# Altium project Carrier-Board-v1.0.PrjPcb (part 1 of 9)
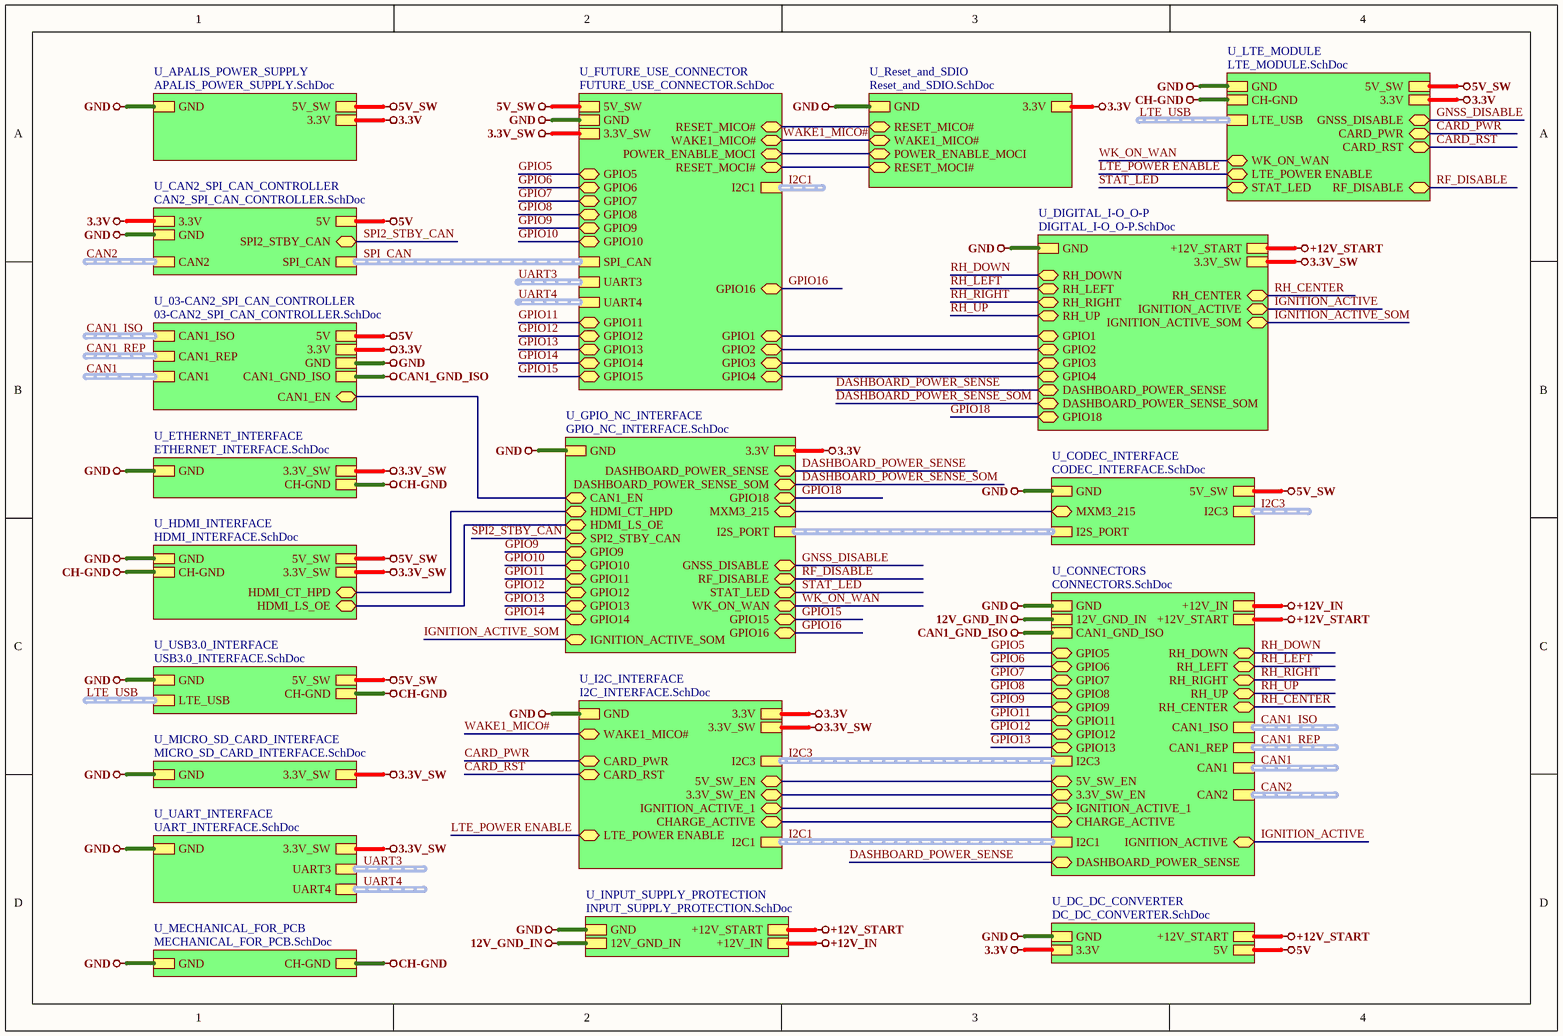
[diagram p0: Top_Sheet.SchDoc]
20 sheets, 430 parts. Net scope: hierarchical (ports join the sheet entries above them; power ports are global).
Board file: Carrier-Board-v1.0.PcbDoc
Sheets:
  Top_Sheet.SchDoc
    U_APALIS_POWER_SUPPLY = APALIS_POWER_SUPPLY.SchDoc
    U_CAN2_SPI_CAN_CONTROLLER = CAN2_SPI_CAN_CONTROLLER.SchDoc
    U_03-CAN2_SPI_CAN_CONTROLLER = 03-CAN2_SPI_CAN_CONTROLLER.SchDoc
    U_ETHERNET_INTERFACE = ETHERNET_INTERFACE.SchDoc
    U_HDMI_INTERFACE = HDMI_INTERFACE.SchDoc
    U_USB3.0_INTERFACE = USB3.0_INTERFACE.SchDoc
    U_MICRO_SD_CARD_INTERFACE = MICRO_SD_CARD_INTERFACE.SchDoc
    U_UART_INTERFACE = UART_INTERFACE.SchDoc
    U_FUTURE_USE_CONNECTOR = FUTURE_USE_CONNECTOR.SchDoc
    U_Reset_and_SDIO = Reset_and_SDIO.SchDoc
    U_I2C_INTERFACE = I2C_INTERFACE.SchDoc
    U_GPIO_NC_INTERFACE = GPIO_NC_INTERFACE.SchDoc
    U_DIGITAL_I-O_O-P = DIGITAL_I-O_O-P.SchDoc
    U_CONNECTORS = CONNECTORS.SchDoc
    U_INPUT_SUPPLY_PROTECTION = INPUT_SUPPLY_PROTECTION.SchDoc
    U_DC_DC_CONVERTER = DC_DC_CONVERTER.SchDoc
    U_MECHANICAL_FOR_PCB = MECHANICAL_FOR_PCB.SchDoc
    U_LTE_MODULE = LTE_MODULE.SchDoc
    U_CODEC_INTERFACE = CODEC_INTERFACE.SchDoc

## Sheet Top_Sheet.SchDoc
size A4; SheetNumber: 1; SheetTotal: 20

### Sub-sheets
U_03-CAN2_SPI_CAN_CONTROLLER = 03-CAN2_SPI_CAN_CONTROLLER.SchDoc: CAN1_ISO (harness CAN1_ISO), CAN1_REP (harness CAN1_REP), CAN1 (harness CAN1), 5V, 3.3V, GND, CAN1_GND_ISO, CAN1_EN (bidir)
U_APALIS_POWER_SUPPLY = APALIS_POWER_SUPPLY.SchDoc: 5V_SW, 3.3V, GND
U_CAN2_SPI_CAN_CONTROLLER = CAN2_SPI_CAN_CONTROLLER.SchDoc: SPI_CAN (harness SPI_CAN), 5V, 3.3V, CAN2 (harness CAN2), SPI2_STBY_CAN (bidir), GND
U_CODEC_INTERFACE = CODEC_INTERFACE.SchDoc: I2C3 (harness I2C3), 5V_SW, GND, MXM3_215 (bidir), I2S_PORT (harness I2S_PORT)
U_CONNECTORS = CONNECTORS.SchDoc: CAN1_ISO (harness CAN1_ISO), CAN1_REP (harness CAN1_REP), CAN1 (harness CAN1), CAN1_GND_ISO, GPIO5 (bidir), GPIO6 (bidir), GPIO7 (bidir), GPIO8 (bidir), I2C1 (harness I2C1), GPIO9 (bidir), GPIO11 (bidir), GPIO12 (bidir), GPIO13 (bidir), 5V_SW_EN (bidir), 3.3V_SW_EN (bidir), IGNITION_ACTIVE_1 (bidir), CHARGE_ACTIVE (bidir), +12V_START, IGNITION_ACTIVE (bidir), RH_RIGHT (bidir), RH_CENTER (bidir), RH_UP (bidir), RH_DOWN (bidir), RH_LEFT (bidir), DASHBOARD_POWER_SENSE (bidir), I2C3 (harness I2C3), +12V_IN, CAN2 (harness CAN2), GND, 12V_GND_IN
U_DC_DC_CONVERTER = DC_DC_CONVERTER.SchDoc: +12V_START, GND, 5V, 3.3V
U_DIGITAL_I-O_O-P = DIGITAL_I-O_O-P.SchDoc: RH_UP (bidir), GPIO1 (bidir), RH_DOWN (bidir), RH_LEFT (bidir), GPIO3 (bidir), RH_RIGHT (bidir), DASHBOARD_POWER_SENSE (bidir), DASHBOARD_POWER_SENSE_SOM (bidir), RH_CENTER (bidir), GPIO18 (bidir), IGNITION_ACTIVE (bidir), IGNITION_ACTIVE_SOM (bidir), +12V_START, GND, 3.3V_SW, GPIO2 (bidir), GPIO4 (bidir)
U_ETHERNET_INTERFACE = ETHERNET_INTERFACE.SchDoc: GND, CH-GND, 3.3V_SW
U_FUTURE_USE_CONNECTOR = FUTURE_USE_CONNECTOR.SchDoc: 5V_SW, GND, 3.3V_SW, I2C1 (harness I2C1), GPIO9 (bidir), GPIO11 (bidir), GPIO12 (bidir), GPIO13 (bidir), GPIO10 (bidir), GPIO16 (bidir), GPIO15 (bidir), GPIO14 (bidir), UART3 (harness UART3), UART4 (harness UART4), GPIO1 (bidir), GPIO2 (bidir), GPIO3 (bidir), GPIO4 (bidir), GPIO5 (bidir), GPIO6 (bidir), GPIO7 (bidir), GPIO8 (bidir), SPI_CAN (harness SPI_CAN), RESET_MICO# (bidir), WAKE1_MICO# (bidir), POWER_ENABLE_MOCI (bidir), RESET_MOCI# (bidir)
U_GPIO_NC_INTERFACE = GPIO_NC_INTERFACE.SchDoc: SPI2_STBY_CAN (bidir), GND, DASHBOARD_POWER_SENSE (bidir), DASHBOARD_POWER_SENSE_SOM (bidir), CAN1_EN (bidir), HDMI_CT_HPD (bidir), HDMI_LS_OE (bidir), GPIO10 (bidir), GPIO9 (bidir), GPIO18 (bidir), GPIO16 (bidir), GPIO15 (bidir), GPIO14 (bidir), GPIO11 (bidir), GPIO12 (bidir), GPIO13 (bidir), IGNITION_ACTIVE_SOM (bidir), 3.3V, MXM3_215 (bidir), I2S_PORT (harness I2S_PORT), GNSS_DISABLE (bidir), RF_DISABLE (bidir), STAT_LED (bidir), WK_ON_WAN (bidir)
U_HDMI_INTERFACE = HDMI_INTERFACE.SchDoc: 5V_SW, GND, CH-GND, 3.3V_SW, HDMI_CT_HPD (bidir), HDMI_LS_OE (bidir)
U_I2C_INTERFACE = I2C_INTERFACE.SchDoc: GND, 3.3V, 3.3V_SW, 5V_SW_EN (bidir), 3.3V_SW_EN (bidir), I2C3 (harness I2C3), WAKE1_MICO# (bidir), I2C1 (harness I2C1), IGNITION_ACTIVE_1 (bidir), CHARGE_ACTIVE (bidir), LTE_POWER ENABLE (bidir), CARD_PWR (bidir), CARD_RST (bidir)
U_INPUT_SUPPLY_PROTECTION = INPUT_SUPPLY_PROTECTION.SchDoc: +12V_START, GND, +12V_IN, 12V_GND_IN
U_LTE_MODULE = LTE_MODULE.SchDoc: LTE_POWER ENABLE (bidir), 5V_SW, GND, CH-GND, LTE_USB (harness LTE_USB), CARD_PWR (bidir), CARD_RST (bidir), GNSS_DISABLE (bidir), RF_DISABLE (bidir), STAT_LED (bidir), 3.3V, WK_ON_WAN (bidir)
U_MECHANICAL_FOR_PCB = MECHANICAL_FOR_PCB.SchDoc: GND, CH-GND
U_MICRO_SD_CARD_INTERFACE = MICRO_SD_CARD_INTERFACE.SchDoc: GND, 3.3V_SW
U_Reset_and_SDIO = Reset_and_SDIO.SchDoc: GND, 3.3V, RESET_MICO# (bidir), WAKE1_MICO# (bidir), POWER_ENABLE_MOCI (bidir), RESET_MOCI# (bidir)
U_UART_INTERFACE = UART_INTERFACE.SchDoc: GND, 3.3V_SW, UART3 (harness UART3), UART4 (harness UART4)
U_USB3.0_INTERFACE = USB3.0_INTERFACE.SchDoc: 5V_SW, GND, CH-GND, LTE_USB (harness LTE_USB)

### Nets
3.3V: sheet U_APALIS_POWER_SUPPLY/3.3V, sheet U_CAN2_SPI_CAN_CONTROLLER/3.3V, sheet U_03-CAN2_SPI_CAN_CONTROLLER/3.3V, sheet U_Reset_and_SDIO/3.3V, sheet U_I2C_INTERFACE/3.3V, sheet U_GPIO_NC_INTERFACE/3.3V, sheet U_DC_DC_CONVERTER/3.3V, sheet U_LTE_MODULE/3.3V
3.3V_SW: sheet U_ETHERNET_INTERFACE/3.3V_SW, sheet U_HDMI_INTERFACE/3.3V_SW, sheet U_MICRO_SD_CARD_INTERFACE/3.3V_SW, sheet U_UART_INTERFACE/3.3V_SW, sheet U_FUTURE_USE_CONNECTOR/3.3V_SW, sheet U_I2C_INTERFACE/3.3V_SW, sheet U_DIGITAL_I-O_O-P/3.3V_SW
5V: sheet U_CAN2_SPI_CAN_CONTROLLER/5V, sheet U_03-CAN2_SPI_CAN_CONTROLLER/5V, sheet U_DC_DC_CONVERTER/5V
5V_SW: sheet U_APALIS_POWER_SUPPLY/5V_SW, sheet U_HDMI_INTERFACE/5V_SW, sheet U_USB3.0_INTERFACE/5V_SW, sheet U_FUTURE_USE_CONNECTOR/5V_SW, sheet U_LTE_MODULE/5V_SW, sheet U_CODEC_INTERFACE/5V_SW
12V_GND_IN: sheet U_CONNECTORS/12V_GND_IN, sheet U_INPUT_SUPPLY_PROTECTION/12V_GND_IN
+12V_IN: sheet U_CONNECTORS/+12V_IN, sheet U_INPUT_SUPPLY_PROTECTION/+12V_IN
+12V_START: sheet U_DIGITAL_I-O_O-P/+12V_START, sheet U_CONNECTORS/+12V_START, sheet U_INPUT_SUPPLY_PROTECTION/+12V_START, sheet U_DC_DC_CONVERTER/+12V_START
CAN1_GND_ISO: sheet U_03-CAN2_SPI_CAN_CONTROLLER/CAN1_GND_ISO, sheet U_CONNECTORS/CAN1_GND_ISO
CH-GND: sheet U_ETHERNET_INTERFACE/CH-GND, sheet U_HDMI_INTERFACE/CH-GND, sheet U_USB3.0_INTERFACE/CH-GND, sheet U_MECHANICAL_FOR_PCB/CH-GND, sheet U_LTE_MODULE/CH-GND
GND: sheet U_APALIS_POWER_SUPPLY/GND, sheet U_CAN2_SPI_CAN_CONTROLLER/GND, sheet U_03-CAN2_SPI_CAN_CONTROLLER/GND, sheet U_ETHERNET_INTERFACE/GND, sheet U_HDMI_INTERFACE/GND, sheet U_USB3.0_INTERFACE/GND, sheet U_MICRO_SD_CARD_INTERFACE/GND, sheet U_UART_INTERFACE/GND, sheet U_FUTURE_USE_CONNECTOR/GND, sheet U_Reset_and_SDIO/GND, sheet U_I2C_INTERFACE/GND, sheet U_GPIO_NC_INTERFACE/GND, sheet U_DIGITAL_I-O_O-P/GND, sheet U_CONNECTORS/GND, sheet U_INPUT_SUPPLY_PROTECTION/GND, sheet U_DC_DC_CONVERTER/GND, sheet U_MECHANICAL_FOR_PCB/GND, sheet U_LTE_MODULE/GND, sheet U_CODEC_INTERFACE/GND
3.3V_SW_EN: sheet U_I2C_INTERFACE/3.3V_SW_EN, sheet U_CONNECTORS/3.3V_SW_EN
5V_SW_EN: sheet U_I2C_INTERFACE/5V_SW_EN, sheet U_CONNECTORS/5V_SW_EN
CAN1_EN: sheet U_03-CAN2_SPI_CAN_CONTROLLER/CAN1_EN, sheet U_GPIO_NC_INTERFACE/CAN1_EN
CARD_PWR: sheet U_I2C_INTERFACE/CARD_PWR, sheet U_LTE_MODULE/CARD_PWR
CARD_RST: sheet U_I2C_INTERFACE/CARD_RST, sheet U_LTE_MODULE/CARD_RST
CHARGE_ACTIVE: sheet U_I2C_INTERFACE/CHARGE_ACTIVE, sheet U_CONNECTORS/CHARGE_ACTIVE
DASHBOARD_POWER_SENSE: sheet U_GPIO_NC_INTERFACE/DASHBOARD_POWER_SENSE, sheet U_DIGITAL_I-O_O-P/DASHBOARD_POWER_SENSE, sheet U_CONNECTORS/DASHBOARD_POWER_SENSE
DASHBOARD_POWER_SENSE_SOM: sheet U_GPIO_NC_INTERFACE/DASHBOARD_POWER_SENSE_SOM, sheet U_DIGITAL_I-O_O-P/DASHBOARD_POWER_SENSE_SOM
GNSS_DISABLE: sheet U_GPIO_NC_INTERFACE/GNSS_DISABLE, sheet U_LTE_MODULE/GNSS_DISABLE
GPIO1: sheet U_FUTURE_USE_CONNECTOR/GPIO1, sheet U_DIGITAL_I-O_O-P/GPIO1
GPIO2: sheet U_FUTURE_USE_CONNECTOR/GPIO2, sheet U_DIGITAL_I-O_O-P/GPIO2
GPIO3: sheet U_FUTURE_USE_CONNECTOR/GPIO3, sheet U_DIGITAL_I-O_O-P/GPIO3
GPIO4: sheet U_FUTURE_USE_CONNECTOR/GPIO4, sheet U_DIGITAL_I-O_O-P/GPIO4
GPIO5: sheet U_FUTURE_USE_CONNECTOR/GPIO5, sheet U_CONNECTORS/GPIO5
GPIO6: sheet U_FUTURE_USE_CONNECTOR/GPIO6, sheet U_CONNECTORS/GPIO6
GPIO7: sheet U_FUTURE_USE_CONNECTOR/GPIO7, sheet U_CONNECTORS/GPIO7
GPIO8: sheet U_FUTURE_USE_CONNECTOR/GPIO8, sheet U_CONNECTORS/GPIO8
GPIO9: sheet U_FUTURE_USE_CONNECTOR/GPIO9, sheet U_GPIO_NC_INTERFACE/GPIO9, sheet U_CONNECTORS/GPIO9
GPIO10: sheet U_FUTURE_USE_CONNECTOR/GPIO10, sheet U_GPIO_NC_INTERFACE/GPIO10
GPIO11: sheet U_FUTURE_USE_CONNECTOR/GPIO11, sheet U_GPIO_NC_INTERFACE/GPIO11, sheet U_CONNECTORS/GPIO11
GPIO12: sheet U_FUTURE_USE_CONNECTOR/GPIO12, sheet U_GPIO_NC_INTERFACE/GPIO12, sheet U_CONNECTORS/GPIO12
GPIO13: sheet U_FUTURE_USE_CONNECTOR/GPIO13, sheet U_GPIO_NC_INTERFACE/GPIO13, sheet U_CONNECTORS/GPIO13
GPIO14: sheet U_FUTURE_USE_CONNECTOR/GPIO14, sheet U_GPIO_NC_INTERFACE/GPIO14
GPIO15: sheet U_FUTURE_USE_CONNECTOR/GPIO15, sheet U_GPIO_NC_INTERFACE/GPIO15
GPIO16: sheet U_FUTURE_USE_CONNECTOR/GPIO16, sheet U_GPIO_NC_INTERFACE/GPIO16
GPIO18: sheet U_GPIO_NC_INTERFACE/GPIO18, sheet U_DIGITAL_I-O_O-P/GPIO18
HDMI_CT_HPD: sheet U_HDMI_INTERFACE/HDMI_CT_HPD, sheet U_GPIO_NC_INTERFACE/HDMI_CT_HPD
HDMI_LS_OE: sheet U_HDMI_INTERFACE/HDMI_LS_OE, sheet U_GPIO_NC_INTERFACE/HDMI_LS_OE
IGNITION_ACTIVE: sheet U_DIGITAL_I-O_O-P/IGNITION_ACTIVE, sheet U_CONNECTORS/IGNITION_ACTIVE
IGNITION_ACTIVE_1: sheet U_I2C_INTERFACE/IGNITION_ACTIVE_1, sheet U_CONNECTORS/IGNITION_ACTIVE_1
IGNITION_ACTIVE_SOM: sheet U_GPIO_NC_INTERFACE/IGNITION_ACTIVE_SOM, sheet U_DIGITAL_I-O_O-P/IGNITION_ACTIVE_SOM
LTE_POWER ENABLE: sheet U_I2C_INTERFACE/LTE_POWER ENABLE, sheet U_LTE_MODULE/LTE_POWER ENABLE
MXM3_215: sheet U_GPIO_NC_INTERFACE/MXM3_215, sheet U_CODEC_INTERFACE/MXM3_215
POWER_ENABLE_MOCI: sheet U_FUTURE_USE_CONNECTOR/POWER_ENABLE_MOCI, sheet U_Reset_and_SDIO/POWER_ENABLE_MOCI
RESET_MICO#: sheet U_FUTURE_USE_CONNECTOR/RESET_MICO#, sheet U_Reset_and_SDIO/RESET_MICO#
RESET_MOCI#: sheet U_FUTURE_USE_CONNECTOR/RESET_MOCI#, sheet U_Reset_and_SDIO/RESET_MOCI#
RF_DISABLE: sheet U_GPIO_NC_INTERFACE/RF_DISABLE, sheet U_LTE_MODULE/RF_DISABLE
RH_CENTER: sheet U_DIGITAL_I-O_O-P/RH_CENTER, sheet U_CONNECTORS/RH_CENTER
RH_DOWN: sheet U_DIGITAL_I-O_O-P/RH_DOWN, sheet U_CONNECTORS/RH_DOWN
RH_LEFT: sheet U_DIGITAL_I-O_O-P/RH_LEFT, sheet U_CONNECTORS/RH_LEFT
RH_RIGHT: sheet U_DIGITAL_I-O_O-P/RH_RIGHT, sheet U_CONNECTORS/RH_RIGHT
RH_UP: sheet U_DIGITAL_I-O_O-P/RH_UP, sheet U_CONNECTORS/RH_UP
SPI2_STBY_CAN: sheet U_CAN2_SPI_CAN_CONTROLLER/SPI2_STBY_CAN, sheet U_GPIO_NC_INTERFACE/SPI2_STBY_CAN
STAT_LED: sheet U_GPIO_NC_INTERFACE/STAT_LED, sheet U_LTE_MODULE/STAT_LED
WAKE1_MICO#: sheet U_FUTURE_USE_CONNECTOR/WAKE1_MICO#, sheet U_Reset_and_SDIO/WAKE1_MICO#, sheet U_I2C_INTERFACE/WAKE1_MICO#
WK_ON_WAN: sheet U_GPIO_NC_INTERFACE/WK_ON_WAN, sheet U_LTE_MODULE/WK_ON_WAN

### Buses and harness runs
harness CAN1 = sheet U_03-CAN2_SPI_CAN_CONTROLLER/CAN1
harness CAN1 = sheet U_CONNECTORS/CAN1
harness CAN1_ISO = sheet U_03-CAN2_SPI_CAN_CONTROLLER/CAN1_ISO
harness CAN1_ISO = sheet U_CONNECTORS/CAN1_ISO
harness CAN1_REP = sheet U_03-CAN2_SPI_CAN_CONTROLLER/CAN1_REP
harness CAN1_REP = sheet U_CONNECTORS/CAN1_REP
harness CAN2 = sheet U_CAN2_SPI_CAN_CONTROLLER/CAN2
harness CAN2 = sheet U_CONNECTORS/CAN2
harness I2C1 = sheet U_CONNECTORS/I2C1 = sheet U_I2C_INTERFACE/I2C1
harness I2C1 = sheet U_FUTURE_USE_CONNECTOR/I2C1
harness I2C3 = sheet U_CODEC_INTERFACE/I2C3
harness I2C3 = sheet U_CONNECTORS/I2C3 = sheet U_I2C_INTERFACE/I2C3
harness LTE_USB = sheet U_LTE_MODULE/LTE_USB
harness LTE_USB = sheet U_USB3.0_INTERFACE/LTE_USB
harness sheet U_CODEC_INTERFACE/I2S_PORT = sheet U_GPIO_NC_INTERFACE/I2S_PORT
harness SPI_CAN = sheet U_CAN2_SPI_CAN_CONTROLLER/SPI_CAN = sheet U_FUTURE_USE_CONNECTOR/SPI_CAN
harness UART3 = sheet U_FUTURE_USE_CONNECTOR/UART3
harness UART3 = sheet U_UART_INTERFACE/UART3
harness UART4 = sheet U_FUTURE_USE_CONNECTOR/UART4
harness UART4 = sheet U_UART_INTERFACE/UART4

## Sheet APALIS_POWER_SUPPLY.SchDoc
size A4; SheetNumber: 2; SheetTotal: 20
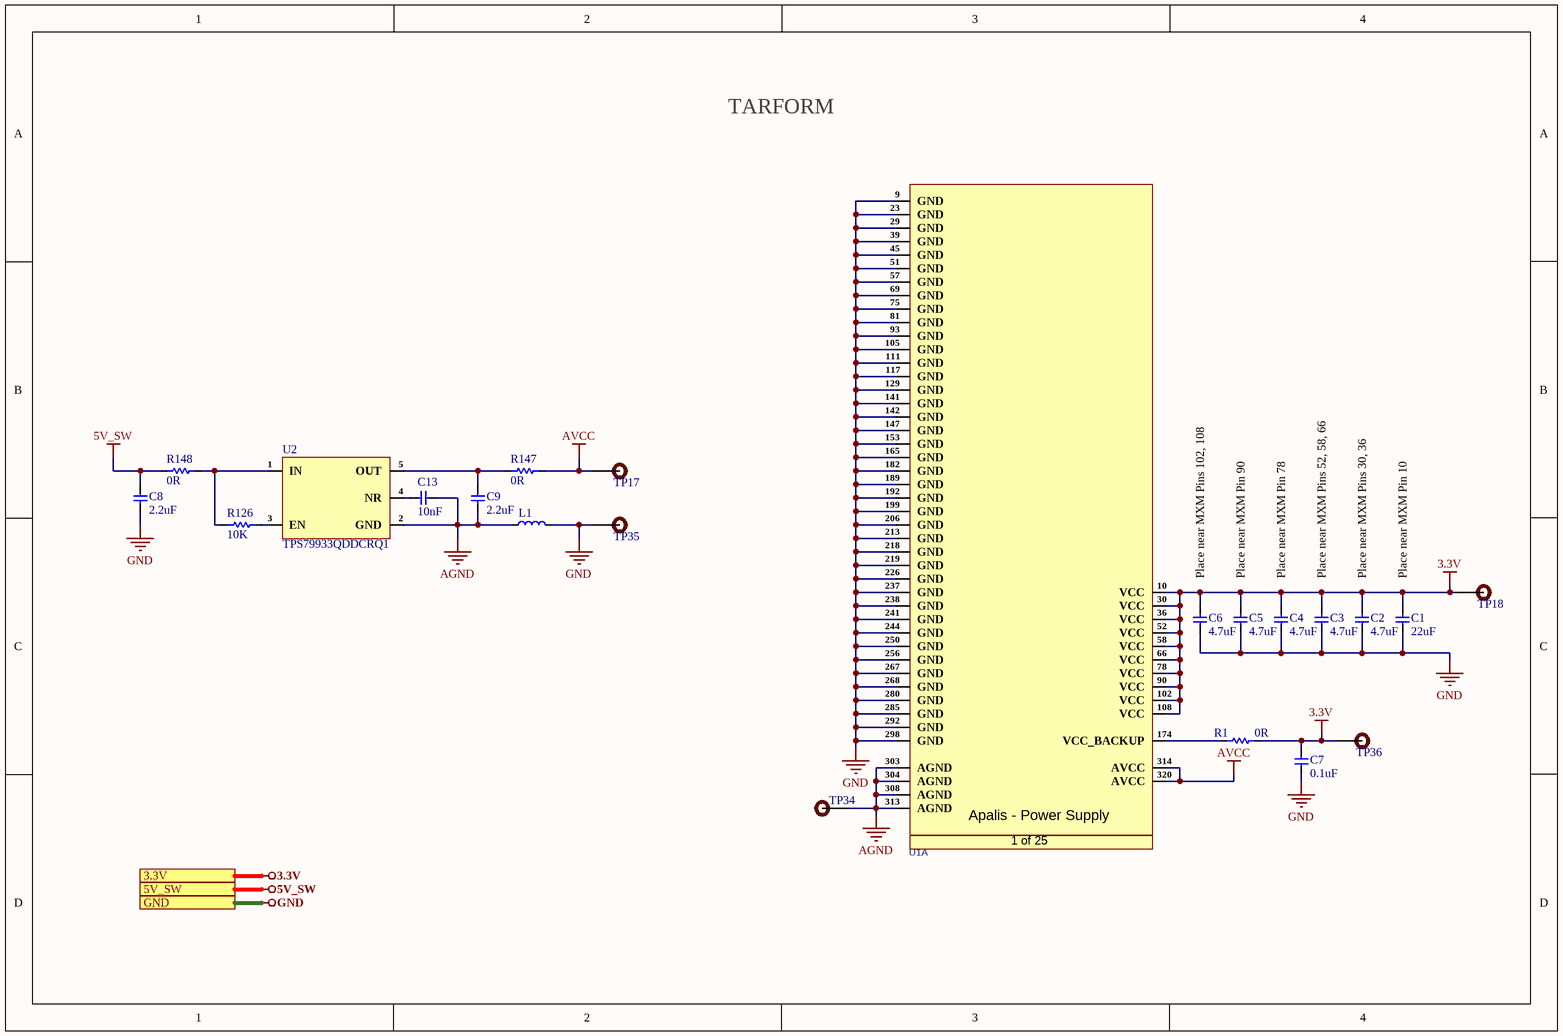
[diagram p1: APALIS_POWER_SUPPLY.SchDoc]

### Parts
C1  22uF  [Cap-0805]
C2  4.7uF  [Cap-0603]
C3  4.7uF  [Cap-0603]
C4  4.7uF  [Cap-0603]
C5  4.7uF  [Cap-0603]
C6  4.7uF  [Cap-0603]
C7  0.1uF  [Cap-0402]
C8  2.2uF  [Cap-0603]
C9  2.2uF  [Cap-0603]
C13  10nF  [Cap-0402]
L1  BLM18PG330SH1D  [IND-0603 (1608 Metric)]  (value not drawn)
R1  0R  [Res-0402]
R126  10K  [Res-0603]
R147  0R  [Res-1206]
R148  0R  [Res-1206]
TP17  DNP  [Test-point]  (value not drawn)
TP18  DNP  [Test-point]  (value not drawn)
TP34  DNP  [Test-point]  (value not drawn)
TP35  DNP  [Test-point]  (value not drawn)
TP36  DNP  [Test-point]  (value not drawn)
U1  MM70-314B1-2-R300  [MM70-314B1-2-R300]  (value not drawn)  (part A of 25)
U2  TPS79933QDDCRQ1  [SOT-23-5]

### Ports
3.3V (see Top_Sheet[1A], 03-CAN2_SPI_CAN_CONTROLLER[1D], CAN2_SPI_CAN_CONTROLLER[1D], DC_DC_CONVERTER[1D], GPIO_NC_INTERFACE[4B], I2C_INTERFACE[1B], LTE_MODULE[1D], Reset_and_SDIO[1D]), 5V_SW (see Top_Sheet[1A], CODEC_INTERFACE[1D], FUTURE_USE_CONNECTOR[1D], HDMI_INTERFACE[1D], LTE_MODULE[1D], USB3.0_INTERFACE[1D]), GND (see Top_Sheet[1A], 03-CAN2_SPI_CAN_CONTROLLER[1D], CAN2_SPI_CAN_CONTROLLER[1D], CODEC_INTERFACE[1D], CONNECTORS[1D], DC_DC_CONVERTER[1D], DIGITAL_I-O_O-P[1D], ETHERNET_INTERFACE[1D], FUTURE_USE_CONNECTOR[1D], GPIO_NC_INTERFACE[4B], HDMI_INTERFACE[1D], I2C_INTERFACE[1B], INPUT_SUPPLY_PROTECTION[1D], LTE_MODULE[1D], MECHANICAL_FOR_PCB[1D], MICRO_SD_CARD_INTERFACE[1D], Reset_and_SDIO[1D], UART_INTERFACE[1D], USB3.0_INTERFACE[1D])

### Nets
3.3V: C1.2 C2.2 C3.2 C4.2 C5.2 C6.2 C7.2 R1.2 TP18.1 TP36.1 U1.10(VCC) U1.30(VCC) U1.36(VCC) U1.52(VCC) U1.58(VCC) U1.66(VCC) U1.78(VCC) U1.90(VCC) U1.102(VCC) U1.108(VCC) ; port 3.3V
5V_SW: C8.2 R148.1 ; port 5V_SW
AGND: C9.1 C13.2 L1.1 TP34.1 U1.303(AGND) U1.304(AGND) U1.308(AGND) U1.313(AGND) U2.2(GND)
AVCC: R147.2 TP17.1 U1.314(AVCC) U1.320(AVCC)
GND: C1.1 C2.1 C3.1 C4.1 C5.1 C6.1 C7.1 C8.1 L1.2 TP35.1 U1.9(GND) U1.23(GND) U1.29(GND) U1.39(GND) U1.45(GND) U1.51(GND) U1.57(GND) U1.69(GND) U1.75(GND) U1.81(GND) U1.93(GND) U1.105(GND) U1.111(GND) U1.117(GND) U1.129(GND) U1.141(GND) U1.142(GND) U1.147(GND) U1.153(GND) U1.165(GND) U1.182(GND) U1.189(GND) U1.192(GND) U1.199(GND) U1.206(GND) U1.213(GND) U1.218(GND) U1.219(GND) U1.226(GND) U1.237(GND) U1.238(GND) U1.241(GND) U1.244(GND) U1.250(GND) U1.256(GND) U1.267(GND) U1.268(GND) U1.280(GND) U1.285(GND) U1.292(GND) U1.298(GND) ; port GND
NetC9_2: C9.2 R147.1 U2.5(OUT)
NetC13_1: C13.1 U2.4(NR)
NetR1_1: R1.1 U1.174(VCC_BACKUP)
NetR126_1: R126.1 R148.2 U2.1(IN)
NetR126_2: R126.2 U2.3(EN)

### Notes on the sheet
- TARFORM
- Place near MXM Pins 102, 108
- Place near MXM Pin 90
- Place near MXM Pin 78
- Place near MXM Pins 52, 58, 66
- Place near MXM Pins 30, 36
- Place near MXM Pin 10
- (in symbol MM70-314B1-2-R300, part A) Apalis - Power Supply; 1 of 25

### Library data of the parts
C1 = C2012X5R1A226M125AB: CAP CER 22UF 10V X5R 0805; Manufacturer: TDK; Dielectric Material: Ceramic; Tolerance: 20%; Item Type: Capacitor; Supplier: Rs; Supplier Part Number: 9159265; Manufacturer Part Number: C2012X5R1A226M125AB; RoHS: Yes; Category: Ceramic Capacitors; Stock: 2720; Pricing: 20=0.186, 100=0.121, 200=0.112, 500=0.103, 1000=0.093 (GBP); Mounting Technology: Surface Mount; Case/Package: 0805; Pins: 2; Case Code (Metric): 2012; Case Code (Imperial): 0805; Weight: 0.000194oz; Min Operating Temperature: -55°C; Max Operating Temperature: 85°C; Voltage Rating (DC): 10V; Packaging: Tape and Reel; Value: 22uF; Dielectric: X5R; Construction: Flat; Package Quantity: 1; Voltage Rating: 10V; Termination: SMD/SMT; Series: C; Length: 2mm; Width: 0.049inch; Height: 1.25mm; Depth: 1.25mm; Thickness: 0.057inch; Lead Free: Lead Free; RoHS Compliant: Yes; Reach SVHC Compliant: Unknown; ComponentLink1URL: https://datasheet.ciiva.com/24216/c2012x5r1a226m125ab-264884-24216051.pdf?src-supplier=Mouser; ComponentLink1Description: https://datasheet.ciiva.com/24216/c2012x5r1a226m125ab-264884-24216051.pdf?src-supplier=Mouser; ComponentLink2URL: https://datasheet.ciiva.com/6287/tdkmlcccaprange-6287852.pdf?src-supplier=Digi-Key; ComponentLink2Description: https://datasheet.ciiva.com/6287/tdkmlcccaprange-6287852.pdf?src-supplier=Digi-Key; ComponentLink3URL: https://datasheet.ciiva.com/6287/tdkmlcccaprange-6287847.pdf?src-supplier=Digi-Key; ComponentLink3Description: https://datasheet.ciiva.com/6287/tdkmlcccaprange-6287847.pdf?src-supplier=Digi-Key; ComponentLink4URL: https://datasheet.ciiva.com/23803/1796654-23803018.pdf?src-supplier=Newark; ComponentLink4Description: https://datasheet.ciiva.com/23803/1796654-23803018.pdf?src-supplier=Newark; ComponentLink5URL: https://datasheet.ciiva.com/16384/general-b11-16384554.pdf?src-supplier=Future+Electronics; ComponentLink5Description: https://datasheet.ciiva.com/16384/general-b11-16384554.pdf?src-supplier=Future+Electronics
C2-C6 = C1608X5R1A475K080AE: CAP CER 4.7UF 10V X5R 0603; Manufacturer: TDK; Item Type: Capacitor; Supplier: Arrow Electronics; Supplier Part Number: C1608X5R1A475K080AE; Manufacturer Part Number: C1608X5R1A475K080AE; RoHS: Yes; Category: Ceramic Capacitors; Stock: 1894; Pricing: 1=0.1954, 10=0.1074, 25=0.1063, 50=0.1053, 100=0.0737, 250=0.073, 500=0.0723, 1000=0.0631 (USD); ComponentLink1URL: https://product.tdk.com/info/en/catalog/datasheets/mlcc_commercial_soft_en.pdf?src-supplier=Digi-Key; ComponentLink1Description: https://product.tdk.com/info/en/catalog/datasheets/mlcc_commercial_soft_en.pdf?src-supplier=Digi-Key; ComponentLink2URL: https://product.tdk.com/info/en/catalog/datasheets/mlcc_commercial_soft_en.pdf?ref_disty=digikey&src-supplier=Digi-Key; ComponentLink2Description: https://product.tdk.com/info/en/catalog/datasheets/mlcc_commercial_soft_en.pdf?ref_disty=digikey&src-supplier=Digi-Key; ComponentLink3URL: https://product.tdk.com/info/en/catalog/spec/mlccspec_commercial_soft_en.pdf?src-supplier=Digi-Key; ComponentLink3Description: https://product.tdk.com/info/en/catalog/spec/mlccspec_commercial_soft_en.pdf?src-supplier=Digi-Key; ComponentLink4URL: https://datasheet.octopart.com/C1608X5R1A475K080AE-TDK-datasheet-60278151.pdf?src-supplier=Future+Electronics; ComponentLink4Description: https://datasheet.octopart.com/C1608X5R1A475K080AE-TDK-datasheet-60278151.pdf?src-supplier=Future+Electronics; ComponentLink5URL: https://datasheet.octopart.com/C1608X5R1A475K080AE-TDK-datasheet-159617022.pdf?src-supplier=TME; ComponentLink5Description: https://datasheet.octopart.com/C1608X5R1A475K080AE-TDK-datasheet-159617022.pdf?src-supplier=TME
C7 = C0402C104K4REC7867: Cap Cer 0402 0.1UF 16V X7R 10%; Manufacturer: KEMET; Item Type: Capacitor; Supplier: Digi-Key; Supplier Part Number: 399-C0402C104K4REC7867CT-ND; Manufacturer Part Number: C0402C104K4REC7867; RoHS: No; Category: Ceramic Capacitors; Stock: 10918; Pricing: 1=0.1, 10=0.072, 50=0.0408, 100=0.0338, 500=0.02372, 1000=0.01963, 2500=0.01827, 5000=0.01672 (USD)
C8 C9 = C1608X7R1A225K080AC: CAP CER 2.2UF 10V X7R 0603; Manufacturer: TDK; Dielectric Material: Ceramic; Tolerance: 10%; Item type: Capacitor; Supplier: Rs; Supplier Part Number: 9040237; Manufacturer Part Number: C1608X7R1A225K080AC; RoHS: Yes; Category: Ceramic Capacitors; Stock: 4700; Pricing: 50=0.061, 250=0.052, 500=0.043, 1000=0.04, 2000=0.036 (GBP); Mounting Technology: Surface Mount; Case/Package: 0603; Case Code (Metric): 1608; Case Code (Imperial): 0603; Weight: 7.1E-05oz; Min Operating Temperature: -55°C; Max Operating Temperature: 125°C; Packaging: Tape and Reel; Value: 2.2uF; Dielectric: X7R; Construction: Flat; Voltage Rating: 10V; Voltage Rating (DC): 10V; Series: C; Package Quantity: 4000; Termination: SMD/SMT; Length: 1.6mm; Width: 0.8mm; Height: 0.8mm; Depth: 0.8mm; Lead Free: Lead Free; Reach SVHC Compliant: No; RoHS Compliant: Yes; ComponentLink1URL: https://datasheet.ciiva.com/24216/c1608x7r1a225k080ac-264808-24216485.pdf?src-supplier=Mouser; ComponentLink1Description: https://datasheet.ciiva.com/24216/c1608x7r1a225k080ac-264808-24216485.pdf?src-supplier=Mouser; ComponentLink2URL: https://datasheet.ciiva.com/22718/1796654-22718012.pdf?src-supplier=Element14; ComponentLink2Description: https://datasheet.ciiva.com/22718/1796654-22718012.pdf?src-supplier=Element14; ComponentLink3URL: https://datasheet.ciiva.com/6290/tdkmlcccaprange-6290821.pdf?src-supplier=Digi-Key; ComponentLink3Description: https://datasheet.ciiva.com/6290/tdkmlcccaprange-6290821.pdf?src-supplier=Digi-Key; ComponentLink4URL: https://datasheet.ciiva.com/6290/tdkmlcccaprange-6290824.pdf?src-supplier=Digi-Key; ComponentLink4Description: https://datasheet.ciiva.com/6290/tdkmlcccaprange-6290824.pdf?src-supplier=Digi-Key; ComponentLink5URL: https://datasheet.ciiva.com/23802/1796654-23802775.pdf?src-supplier=Newark; ComponentLink5Description: https://datasheet.ciiva.com/23802/1796654-23802775.pdf?src-supplier=Newark; ComponentLink6URL: https://datasheet.ciiva.com/28451/1796654-28451240.pdf?src-supplier=Element14; ComponentLink6Description: https://datasheet.ciiva.com/28451/1796654-28451240.pdf?src-supplier=Element14; ComponentLink7URL: https://datasheet.ciiva.com/22725/1913358-22725529.pdf?src-supplier=Element14; ComponentLink7Description: https://datasheet.ciiva.com/22725/1913358-22725529.pdf?src-supplier=Element14
C13 = C0402C103K5RAC7411: CAP CER 10000PF 50V X7R 0402; Manufacturer: KEMET; Dielectric Material: Ceramic; Tolerance: 10%; Item Type: Capacitor; Supplier: Mouser; Supplier Part Number: 80-C0402C103K5R7411; Manufacturer Part Number: C0402C103K5RAC7411; RoHS: Yes; Category: Ceramic Capacitors; Stock: 440672; Pricing: 1=0.1, 10=0.017, 50=0.017, 100=0.009, 1000=0.005, 10000=0.004 (USD); Mounting Technology: Surface Mount; Case/Package: 0402; Min Operating Temperature: -55°C; Max Operating Temperature: 125°C; Value: 10nF; Dielectric: X7R; Voltage Rating (DC): 50V; Construction: Flat; Length: 1mm; Height: 0.5mm; Depth: 0.5mm; Radiation Hardening: No; RoHS Compliant: Yes; ComponentLink1URL: http://capacitoredge.kemet.com/capedge2/DataSheet?pn=C0402C103K5RAC7411&src-supplier=Avnet; ComponentLink1Description: http://capacitoredge.kemet.com/capedge2/DataSheet?pn=C0402C103K5RAC7411&src-supplier=Avnet
L1 = BLM18PG330SH1D: Ferrite Beads Multi-Layer 33Ohm 25% 100MHz 3A 0.025Ohm DCR 0603 Automotive T/R; Manufacturer: Murata; Supplier: Rs; Supplier Part Number: 1048533; Manufacturer Part Number: BLM18PG330SH1D; RoHS: Yes; Category: Ferrite Beads and Chips; Stock: 7800; Pricing: 200=0.032, 1000=0.028, 3000=0.024, 5000=0.021, 10000=0.019 (GBP); ComponentLink1URL: https://datasheet.ciiva.com/29364/l0132s0193blm18p-29364421.pdf?src-supplier=Digi-Key; ComponentLink1Description: https://datasheet.ciiva.com/29364/l0132s0193blm18p-29364421.pdf?src-supplier=Digi-Key; ComponentLink2URL: https://datasheet.ciiva.com/29364/l0132s0193blm18p-29364423.pdf?src-supplier=Digi-Key; ComponentLink2Description: https://datasheet.ciiva.com/29364/l0132s0193blm18p-29364423.pdf?src-supplier=Digi-Key; ComponentLink3URL: https://datasheet.ciiva.com/29364/l0132s0193blm18p-29364425.pdf?src-supplier=Digi-Key; ComponentLink3Description: https://datasheet.ciiva.com/29364/l0132s0193blm18p-29364425.pdf?src-supplier=Digi-Key
R1 = ERJ-2GE0R00X: RES SMD 0 OHM JUMPER 1/10W 0402; Manufacturer: Panasonic; Value: 0mR; Power Rating: 100mW; Voltage Rating: 50V; Tolerance: 5%; Temperature Coefficient: 600ppm/°C; Supplier: Mouser; Supplier Part Number: 667-ERJ-2GE0R00X; Manufacturer Part Number: ERJ-2GE0R00X; RoHS: Yes; Category: Chip SMD Resistors; Stock: 10959876; Pricing: 1=0.1, 10=0.013, 50=0.013, 100=0.006, 1000=0.004, 10000=0.003 (USD); Mounting Technology: Surface Mount; Case/Package: 0402; Pins: 2NUMBER; Contact Plating: Tin; Case Code (Metric): 1005; Case Code (Imperial): 0402; Min Operating Temperature: -55°C; Max Operating Temperature: 155°C; Resistor Type: Thick Film; Packaging: Cut Tape; Package Quantity: 10000; Number of Terminations: 2; Termination: SMD/SMT; Max Power Dissipation: 100mW; Voltage Rating (DC): 50V; Features: Automotive AEC-Q200; Series: ERJ; Construction: Rectangular; Technology: THICK FILM; Length: 1mm; Width: 0.5mm; Height: 0.35mm; Depth: 0.5mm; Ratings: AEC-Q200; Radiation Hardening: No; Reach SVHC Compliant: No; Military Standard: Not; Lead Free: Lead Free; RoHS Compliant: Yes; ComponentLink1URL: https://datasheet.ciiva.com/11821/0900766b80f806dd-11821176.pdf?src-supplier=Rs; ComponentLink1Description: https://datasheet.ciiva.com/11821/0900766b80f806dd-11821176.pdf?src-supplier=Rs; ComponentLink2URL: https://datasheet.ciiva.com/46389/1678796-46389518.pdf?src-supplier=Element14; ComponentLink2Description: https://datasheet.ciiva.com/46389/1678796-46389518.pdf?src-supplier=Element14; ComponentLink3URL: https://datasheet.ciiva.com/28695/1678796-28695758.pdf?src-supplier=Element14; ComponentLink3Description: https://datasheet.ciiva.com/28695/1678796-28695758.pdf?src-supplier=Element14; ComponentLink4URL: https://datasheet.ciiva.com/16778/70260739-16778335.pdf?src-supplier=Allied+Electronics; ComponentLink4Description: https://datasheet.ciiva.com/16778/70260739-16778335.pdf?src-supplier=Allied+Electronics; ComponentLink5URL: https://datasheet.ciiva.com/48531/aoa0000ce1-48531077.pdf?src-supplier=Avnet; ComponentLink5Description: https://datasheet.ciiva.com/48531/aoa0000ce1-48531077.pdf?src-supplier=Avnet; ComponentLink6URL: https://datasheet.ciiva.com/30097/4aoa0000ce1-30097116.pdf?src-supplier=Onlinecomponents.com; ComponentLink6Description: https://datasheet.ciiva.com/30097/4aoa0000ce1-30097116.pdf?src-supplier=Onlinecomponents.com; ComponentLink7URL: https://datasheet.ciiva.com/43460/1678796-43460347.pdf?src-supplier=Farnell; ComponentLink7Description: https://datasheet.ciiva.com/43460/1678796-43460347.pdf?src-supplier=Farnell; ComponentLink8URL: https://datasheet.ciiva.com/5959/1678796-5959692.pdf?src-supplier=Farnell; ComponentLink8Description: https://datasheet.ciiva.com/5959/1678796-5959692.pdf?src-supplier=Farnell; ComponentLink9URL: https://datasheet.ciiva.com/16783/70260739-16783734.pdf?src-supplier=Allied+Electronics; ComponentLink9Description: https://datasheet.ciiva.com/16783/70260739-16783734.pdf?src-supplier=Allied+Electronics
R126 = RCA060310K0FKEAHP: RES SMD 10K OHM 1% 1/10W 0603; Manufacturer: Vishay Dale; Value: 10kR; Max Power Dissipation: 250mW; Temperature Coefficient: 100ppm/°C; Supplier: Future Electronics; Supplier Part Number: 4171415; Manufacturer Part Number: RCA060310K0FKEAHP; RoHS: Yes; Category: Chip SMD Resistors; Stock: 10000; Pricing: 5000=0.0413, 10000=0.0403, 15000=0.0397, 25000=0.0389, 50000=0.0374 (USD); Case/Package: 0603; Case Code (Imperial): 0603; Case Code (Metric): 1608; Min Operating Temperature: -55°C; Max Operating Temperature: 155°C; Features: Automotive AEC-Q200,Anti-Sulfur; Packaging: Cut Tape; Tolerance: 1%; Number of Terminations: 2; Series: RCA-HP; Ratings: AEC-Q200; RoHS Compliant: Yes; ComponentLink1URL: http://www.vishay.com/docs/20067/rcahp.pdf?src-supplier=Digi-Key; ComponentLink1Description: http://www.vishay.com/docs/20067/rcahp.pdf?src-supplier=Digi-Key
R147 R148 = RC1206JR-070RL: RES 0 OHM JUMPER 1/4W 1206; Manufacturer: Yageo; Value: 0mR; Tolerance: 5%; Power Rating: 250mW; Voltage Rating: 200V; Temperature Coefficient: 200ppm/°C; Supplier: Future Electronics; Supplier Part Number: 1070203; Manufacturer Part Number: RC1206JR-070RL; RoHS: Yes; Category: Chip SMD Resistors; Stock: 615000; Pricing: 5000=0.0047, 25000=0.0045, 100000=0.0042, 250000=0.0041, 625000=0.0038 (USD); Case/Package: 1206; Contact Plating: Tin,Matte; Case Code (Metric): 3216; Case Code (Imperial): 1206; Min Operating Temperature: -55°C; Max Operating Temperature: 155°C; Resistor Type: Thick Film,Carbon Film; Packaging: Tape and Reel; Package Quantity: 1; Number of Terminations: 2; Termination: SMD/SMT; Max Power Dissipation: 250mW; Series: RC; Resistance Tolerance: 5%; Technology: THICK FILM; Features: Moisture Resistant; Voltage Rating (AC): 200V; Length: 0.122inch; Width: 0.063inch; Height: 0.026inch; Depth: 1.6mm; Lead Free: Lead Free; RoHS Compliant: Yes; Reach SVHC Compliant: Unknown; ComponentLink1URL: https://datasheet.ciiva.com/11808/0900766b80c6630a-11808156.pdf?src-supplier=Rs; ComponentLink1Description: https://datasheet.ciiva.com/11808/0900766b80c6630a-11808156.pdf?src-supplier=Rs; ComponentLink2URL: https://datasheet.ciiva.com/29181/402222-da-01-en-smd-widerstand-0-ohm-1206-29181568.pdf?src-supplier=Conrad; ComponentLink2Description: https://datasheet.ciiva.com/29181/402222-da-01-en-smd-widerstand-0-ohm-1206-29181568.pdf?src-supplier=Conrad; ComponentLink3URL: https://datasheet.ciiva.com/7983/444357-7983807.pdf?src-supplier=Element14; ComponentLink3Description: https://datasheet.ciiva.com/7983/444357-7983807.pdf?src-supplier=Element14; ComponentLink4URL: https://datasheet.ciiva.com/22747/1692832-22747541.pdf?src-supplier=Element14; ComponentLink4Description: https://datasheet.ciiva.com/22747/1692832-22747541.pdf?src-supplier=Element14; ComponentLink5URL: https://datasheet.ciiva.com/46445/444357-46445719.pdf?src-supplier=Element14; ComponentLink5Description: https://datasheet.ciiva.com/46445/444357-46445719.pdf?src-supplier=Element14; ComponentLink6URL: https://datasheet.ciiva.com/2458/pyu-rc1206-51-rohs-l-4-2458669.pdf?src-supplier=Digi-Key; ComponentLink6Description: https://datasheet.ciiva.com/2458/pyu-rc1206-51-rohs-l-4-2458669.pdf?src-supplier=Digi-Key; ComponentLink7URL: https://datasheet.ciiva.com/2458/pyu-rc1206-51-rohs-l-4-2458670.pdf?src-supplier=Digi-Key; ComponentLink7Description: https://datasheet.ciiva.com/2458/pyu-rc1206-51-rohs-l-4-2458670.pdf?src-supplier=Digi-Key; ComponentLink8URL: https://datasheet.ciiva.com/2458/pyu-rc1206-51-rohs-l-4-2458668.pdf?src-supplier=Digi-Key; ComponentLink8Description: https://datasheet.ciiva.com/2458/pyu-rc1206-51-rohs-l-4-2458668.pdf?src-supplier=Digi-Key; ComponentLink9URL: https://datasheet.ciiva.com/7857/1692832-7857422.pdf?src-supplier=Element14; ComponentLink9Description: https://datasheet.ciiva.com/7857/1692832-7857422.pdf?src-supplier=Element14; ComponentLink10URL: https://datasheet.ciiva.com/7857/1692832-7857421.pdf?src-supplier=Element14; ComponentLink10Description: https://datasheet.ciiva.com/7857/1692832-7857421.pdf?src-supplier=Element14; ComponentLink11URL: https://datasheet.ciiva.com/17035/pyu-rc1206-51-rohs-l-4-17035512.pdf?src-supplier=Future+Electronics; ComponentLink11Description: https://datasheet.ciiva.com/17035/pyu-rc1206-51-rohs-l-4-17035512.pdf?src-supplier=Future+Electronics
TP17 TP18 TP34-TP36 = TEST POINT: Test Point ON; Item Type: TEST POINT
U1 = MM70-314B1-2-R300: CONN MXM 3.0 FMALE 314POS 0.020; Manufacturer: JAE Electronics; Supplier: Digi-Key; Supplier Part Number: 670-MM70-314B1-2-R300CT-ND; Manufacturer Part Number: MM70-314B1-2-R300; RoHS: No; Category: Card Edge Connectors; Stock: 4979; Pricing: 1=9.21, 10=8.287, 25=7.8064, 50=7.6064, 100=7.4062 (USD)
U2 = TPS79933QDDCRQ1: IC REG LINEAR 3.3V 200MA SOT23-5; Manufacturer: Texas Instruments; Supplier: Mouser; Supplier Part Number: 595-TPS79933QDDCRQ1; Manufacturer Part Number: TPS79933QDDCRQ1; RoHS: Yes; Category: Voltage Regulators - Linear; Stock: 7856; Pricing: 1=1.2, 10=1.02, 50=1.02, 100=0.78, 1000=0.544, 10000=0.463 (USD); ComponentLink1URL: https://datasheet.ciiva.com/2044/tps79933-q1-2044901.pdf?src-supplier=Digi-Key; ComponentLink1Description: https://datasheet.ciiva.com/2044/tps79933-q1-2044901.pdf?src-supplier=Digi-Key; ComponentLink2URL: https://datasheet.ciiva.com/14277/tps79933-q1-14277826.pdf?src-supplier=Avnet; ComponentLink2Description: https://datasheet.ciiva.com/14277/tps79933-q1-14277826.pdf?src-supplier=Avnet; Item Type: IC

## Sheet CAN2_SPI_CAN_CONTROLLER.SchDoc
size A4; SheetNumber: 3; SheetTotal: 20; ENG_APP_DATE: --/--/--; DSN_APP_DATE: --/--/--; CHK_APP_DATE: --/--/--
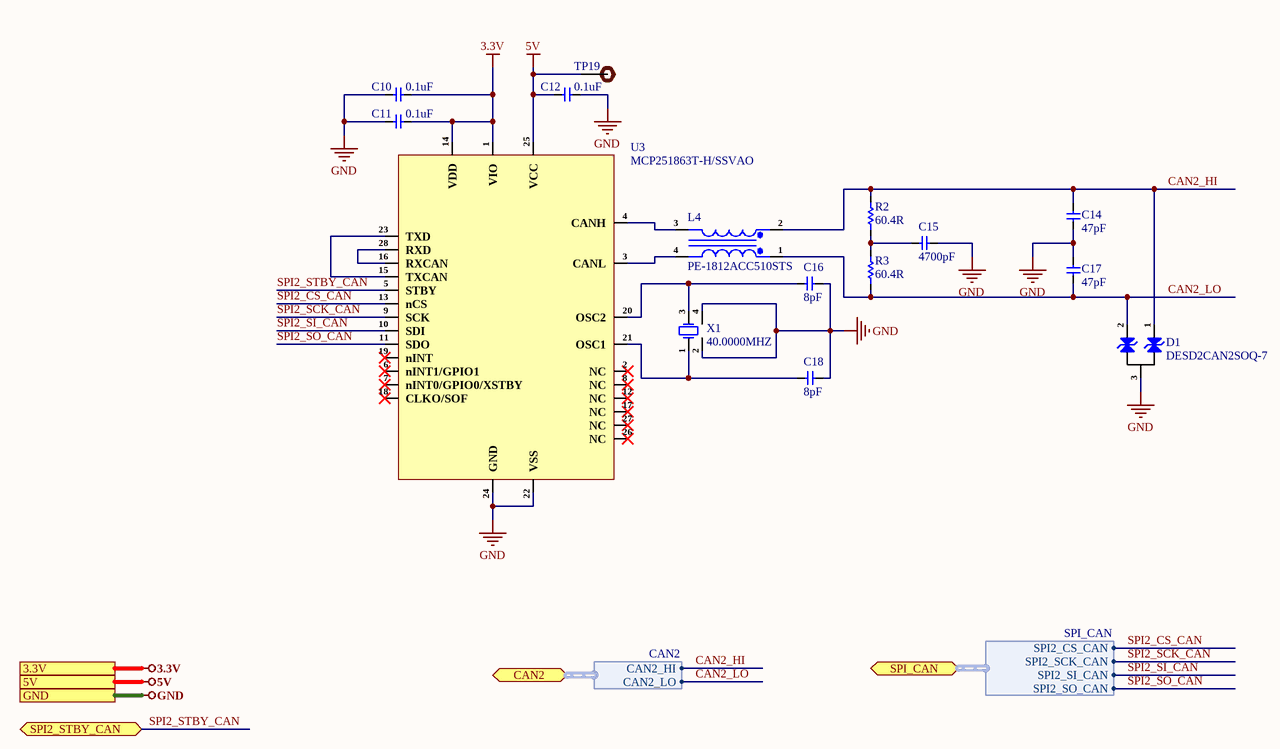
[diagram p2: CAN2_SPI_CAN_CONTROLLER.SchDoc]

### Parts
C10  0.1uF  [Cap-0402]
C11  0.1uF  [Cap-0402]
C12  0.1uF  [Cap-0402]
C14  47pF  [Cap-0805]
C15  4700pF  [Cap-1206]
C16  8pF  [CAP-0201]
C17  47pF  [Cap-0805]
C18  8pF  [CAP-0201]
D1  DESD2CAN2SOQ-7  [SOT-23]
L4  PE-1812ACC510STS  [PE-1812ACC510STS]
R2  60.4R  [Res-0603]
R3  60.4R  [Res-0603]
TP19  DNP  [Test-point]  (value not drawn)
U3  MCP251863T-H/SSVAO  [SSOP-28-208mil]
X1  40.0000MHZ  [NX2016SA-40M-STD-CZS-3]

### Ports
3.3V (see Top_Sheet[1A], 03-CAN2_SPI_CAN_CONTROLLER[1D], APALIS_POWER_SUPPLY[1D], DC_DC_CONVERTER[1D], GPIO_NC_INTERFACE[4B], I2C_INTERFACE[1B], LTE_MODULE[1D], Reset_and_SDIO[1D]), 5V (see Top_Sheet[1A], 03-CAN2_SPI_CAN_CONTROLLER[1D], DC_DC_CONVERTER[1D]), CAN2 (bidir, harness CAN2, see Top_Sheet[1B], CONNECTORS[3C]), GND (see Top_Sheet[1A], 03-CAN2_SPI_CAN_CONTROLLER[1D], APALIS_POWER_SUPPLY[1D], CODEC_INTERFACE[1D], CONNECTORS[1D], DC_DC_CONVERTER[1D], DIGITAL_I-O_O-P[1D], ETHERNET_INTERFACE[1D], FUTURE_USE_CONNECTOR[1D], GPIO_NC_INTERFACE[4B], HDMI_INTERFACE[1D], I2C_INTERFACE[1B], INPUT_SUPPLY_PROTECTION[1D], LTE_MODULE[1D], MECHANICAL_FOR_PCB[1D], MICRO_SD_CARD_INTERFACE[1D], Reset_and_SDIO[1D], UART_INTERFACE[1D], USB3.0_INTERFACE[1D]), SPI2_STBY_CAN (bidir, see Top_Sheet[1A], GPIO_NC_INTERFACE[4A]), SPI_CAN (bidir, harness SPI_CAN, see Top_Sheet[1B], FUTURE_USE_CONNECTOR[3D])

### Harnesses
SPI_CAN: SPI2_CS_CAN, SPI2_SCK_CAN, SPI2_SI_CAN, SPI2_SO_CAN
CAN2: CAN2_HI, CAN2_LO

### Nets
3.3V: C10.1 C11.1 U3.1(VIO) U3.14(VDD) ; port 3.3V
5V: C12.2 TP19.1 U3.25(VCC) ; port 5V
GND: C10.2 C11.2 C12.1 C14.1 C15.2 C16.2 C17.2 C18.1 D1.3 U3.22(VSS) U3.24(GND) X1.2(GND) X1.4(GND) ; port GND
CAN2_HI: C14.2 D1.1 L4.2 R2.2 ; port CAN2.CAN2_HI  [project net CAN2.CAN2_HI]
CAN2_LO: C17.1 D1.2 L4.1 R3.1 ; port CAN2.CAN2_LO  [project net CAN2.CAN2_LO]
SPI2_CS_CAN: U3.13(nCS) ; port SPI_CAN.SPI2_CS_CAN
SPI2_SCK_CAN: U3.9(SCK) ; port SPI_CAN.SPI2_SCK_CAN
SPI2_SI_CAN: U3.10(SDI) ; port SPI_CAN.SPI2_SI_CAN
SPI2_SO_CAN: U3.11(SDO) ; port SPI_CAN.SPI2_SO_CAN
SPI2_STBY_CAN: U3.5(STBY) ; port SPI2_STBY_CAN
NetC15_1: C15.1 R2.1 R3.2
NetC16_1: C16.1 U3.20(OSC2) X1.3(Out/In)
NetC18_2: C18.2 U3.21(OSC1) X1.1(In/Out)
NetL4_3: L4.3 U3.4(CANH)
NetL4_4: L4.4 U3.3(CANL)
NetU3_15: U3.15(TXCAN) U3.23(TXD)
NetU3_16: U3.16(RXCAN) U3.28(RXD)

Not connected (* = marked no-connect by the designer): U3 2(NC)* 6(nINT1/GPIO1)* 7(nINT0/GPIO0/XSTBY)* 8(NC)* 12(NC)* 17(NC)* 18(CLKO/SOF)* 19(nINT)* 26(NC)* 27(NC)*

### Library data of the parts
C10-C12 = C0402C104K4REC7867: as C7 on sheet APALIS_POWER_SUPPLY; Supplier: Digi-Key; Supplier Part Number: 399-C0402C104K4REC7867CT-ND; Manufacturer Part Number: C0402C104K4REC7867; RoHS: No; Category: Ceramic Capacitors; Stock: 10918; Pricing: 1=0.1, 10=0.072, 50=0.0408, 100=0.0338, 500=0.02372, 1000=0.01963, 2500=0.01827, 5000=0.01672 (USD)
C14 C17 = C0805C470K5RACAUTO: Cap Cer 47PF 50V X7R 0805; Manufacturer: KEMET; Supplier: Mouser; Supplier Part Number: 80-C0805C470K5RAUTO; Manufacturer Part Number: C0805C470K5RACAUTO; RoHS: Yes; Category: Ceramic Capacitors; Stock: 12731; Pricing: 1=0.23, 10=0.094, 50=0.094, 100=0.055, 1000=0.048, 10000=0.037 (USD); ComponentLink1URL: https://datasheet.octopart.com/C0805C470K5RACAUTO-KEMET-datasheet-158277466.pdf?src-supplier=Element14; ComponentLink1Description: https://datasheet.octopart.com/C0805C470K5RACAUTO-KEMET-datasheet-158277466.pdf?src-supplier=Element14
C15 = C1206C472K5RACAUTO: CAP CER 4700PF 50V X7R 1206; Manufacturer: KEMET; Supplier: Mouser; Supplier Part Number: 80-C1206C472K5RAUTO; Manufacturer Part Number: C1206C472K5RACAUTO; RoHS: Yes; Category: Ceramic Capacitors; Stock: 3869; Pricing: 1=0.18, 10=0.075, 50=0.075, 100=0.044, 1000=0.036, 10000=0.028 (USD); ComponentLink1URL: https://datasheet.ciiva.com/6259/datasheetpn-c1206c472k5racauto-6259849.pdf?src-supplier=Digi-Key; ComponentLink1Description: https://datasheet.ciiva.com/6259/datasheetpn-c1206c472k5racauto-6259849.pdf?src-supplier=Digi-Key
C16 C18 = CGA1A2C0G1H080D030BA: CAP CER 8PF 50V C0G 0201; Manufacturer: TDK; Material: 4241ConductorMaterial; Temperature Coefficient: 30ppm/°C; Supplier: Digi-Key; Supplier Part Number: 445-12057-1-ND; Manufacturer Part Number: CGA1A2C0G1H080D030BA; RoHS: Yes; Category: Ceramic Capacitors; Stock: 40913; Pricing: 1=0.11, 10=0.078, 50=0.0424, 100=0.0346, 500=0.02474, 1000=0.01944, 2500=0.01768, 5000=0.01626 (USD); Mounting Technology: Surface Mount; Case/Package: 0201; Case Code (Metric): 0603; Case Code (Imperial): 0201; Weight: 6E-06oz; Min Operating Temperature: -55°C; Max Operating Temperature: 125°C; Package Quantity: 15000; Packaging: Tape and Reel; Value: 8pF; Voltage Rating: 50V; Voltage Rating (DC): 50V; Dielectric: C0G; Termination: SMD/SMT; Series: CGA; Length: 0.6mm; Width: 0.3mm; Height: 0.3mm; Ratings: AEC-Q200; RoHS Compliant: Yes; ComponentLink1URL: https://datasheet.ciiva.com/24221/mlcc-automotive-general-en-24221484.pdf?src-supplier=Mouser; ComponentLink1Description: https://datasheet.ciiva.com/24221/mlcc-automotive-general-en-24221484.pdf?src-supplier=Mouser
D1 = DESD2CAN2SOQ-7: TVS DIODE 24VWM 41VC SOT23; Manufacturer: Diodes; Number of Bidirectional Channels: 2; Reverse Standoff Voltage: 24V; Min Breakdown Voltage: 25.4V; Peak Pulse Power: 230W; Power Line Protection: No; Peak Pulse Current: 5A; Diode Type: ZENER; Supplier: Future Electronics; Supplier Part Number: 5053887; Manufacturer Part Number: DESD2CAN2SOQ-7; RoHS: Yes; Category: TVS Diodes; Stock: 18000; Pricing: 3000=0.109, 6000=0.107, 12000=0.105, 15000=0.104, 45000=0.101 (USD); Mounting Technology: Surface Mount; Case/Package: TO-236-3; Min Operating Temperature: -65°C; Max Operating Temperature: 150°C; Packaging: Cut Tape; Series: Automotive, AEC-Q101; RoHS Compliant: Yes; ComponentLink1URL: http://www.farnell.com/datasheets/2814365.pdf?src-supplier=Farnell; ComponentLink1Description: http://www.farnell.com/datasheets/2814365.pdf?src-supplier=Farnell; ComponentLink2URL: http://www.mouser.com/ds/2/115/DESD2CAN2SOQ-520157.pdf?src-supplier=Mouser; ComponentLink2Description: http://www.mouser.com/ds/2/115/DESD2CAN2SOQ-520157.pdf?src-supplier=Mouser; ComponentLink3URL: http://www.farnell.com/datasheets/2814365.pdf?src-supplier=Newark; ComponentLink3Description: http://www.farnell.com/datasheets/2814365.pdf?src-supplier=Newark; ComponentLink4URL: http://www.farnell.com/datasheets/2814365.pdf?src-supplier=Element14; ComponentLink4Description: http://www.farnell.com/datasheets/2814365.pdf?src-supplier=Element14; ComponentLink5URL: https://www.diodes.com/assets/Datasheets/DESD2CAN2SOQ.pdf?src-supplier=Digi-Key; ComponentLink5Description: https://www.diodes.com/assets/Datasheets/DESD2CAN2SOQ.pdf?src-supplier=Digi-Key
L4 = PE-1812ACC510STS: CMC 230MA 2LN 3.5KOHM SMD; Manufacturer: Pulse Electronics Network; Supplier: Future Electronics; Supplier Part Number: 5113590; Manufacturer Part Number: PE-1812ACC510STS; RoHS: No
R2 R3 = RC0603FR-0760R4L: RES 60.4 OHM 1% 1/10W 0603; Manufacturer: Yageo; Supplier: Rs; Supplier Part Number: 2424164; Manufacturer Part Number: RC0603FR-0760R4L; RoHS: Yes; Category: Chip SMD Resistors; Stock: 8600; Pricing: 100=0.008, 1000=0.007, 2000=0.006 (GBP); ComponentLink1URL: https://datasheet.ciiva.com/12558/rc0603-272842-12558933.pdf?src-supplier=Mouser; ComponentLink1Description: https://datasheet.ciiva.com/12558/rc0603-272842-12558933.pdf?src-supplier=Mouser
TP19 = TEST POINT: Test Point ON; Item Type: TEST POINT
U3 = MCP251863T-H/SSVAO: STAND-ALONE LOW POWER CAN FD CON; Manufacturer: Microchip; Item Type: IC; Supplier: Digi-Key; Supplier Part Number: 150-MCP251863T-H/SSVAOTR-ND; Manufacturer Part Number: MCP251863T-H/SSVAO; RoHS: No; Category: Uncategorized
X1 = NX2016SA-40M-STD-CZS-3: Crystal 40.0000MHZ 8PF SMD; Manufacturer: NDK; Frequency: 40MHz; Frequency Stability: 25ppm; Frequency Tolerance: 10ppm; ESR (Equivalent Series Resistance): 60R; Supplier: Rs; Supplier Part Number: 1847956; Manufacturer Part Number: NX2016SA-40M-STD-CZS-3; RoHS: Yes; Stock: 95; Pricing: 5=0.686 (GBP); Mounting Technology: Surface Mount; Case/Package: SMD/SMT; Min Operating Temperature: -40°C; Max Operating Temperature: 125°C; Packaging: Cut Tape; Load Capacitance: 8pF; Series: -; Ratings: AEC-Q200; RoHS Compliant: Yes; ComponentLink1URL: http://www.ndk.com/images/products/catalog/c_NX2016SA-2_e.pdf?src-supplier=Digi-Key; ComponentLink1Description: http://www.ndk.com/images/products/catalog/c_NX2016SA-2_e.pdf?src-supplier=Digi-Key